# Altium project datalogger.PrjPcb (part 2 of 2)
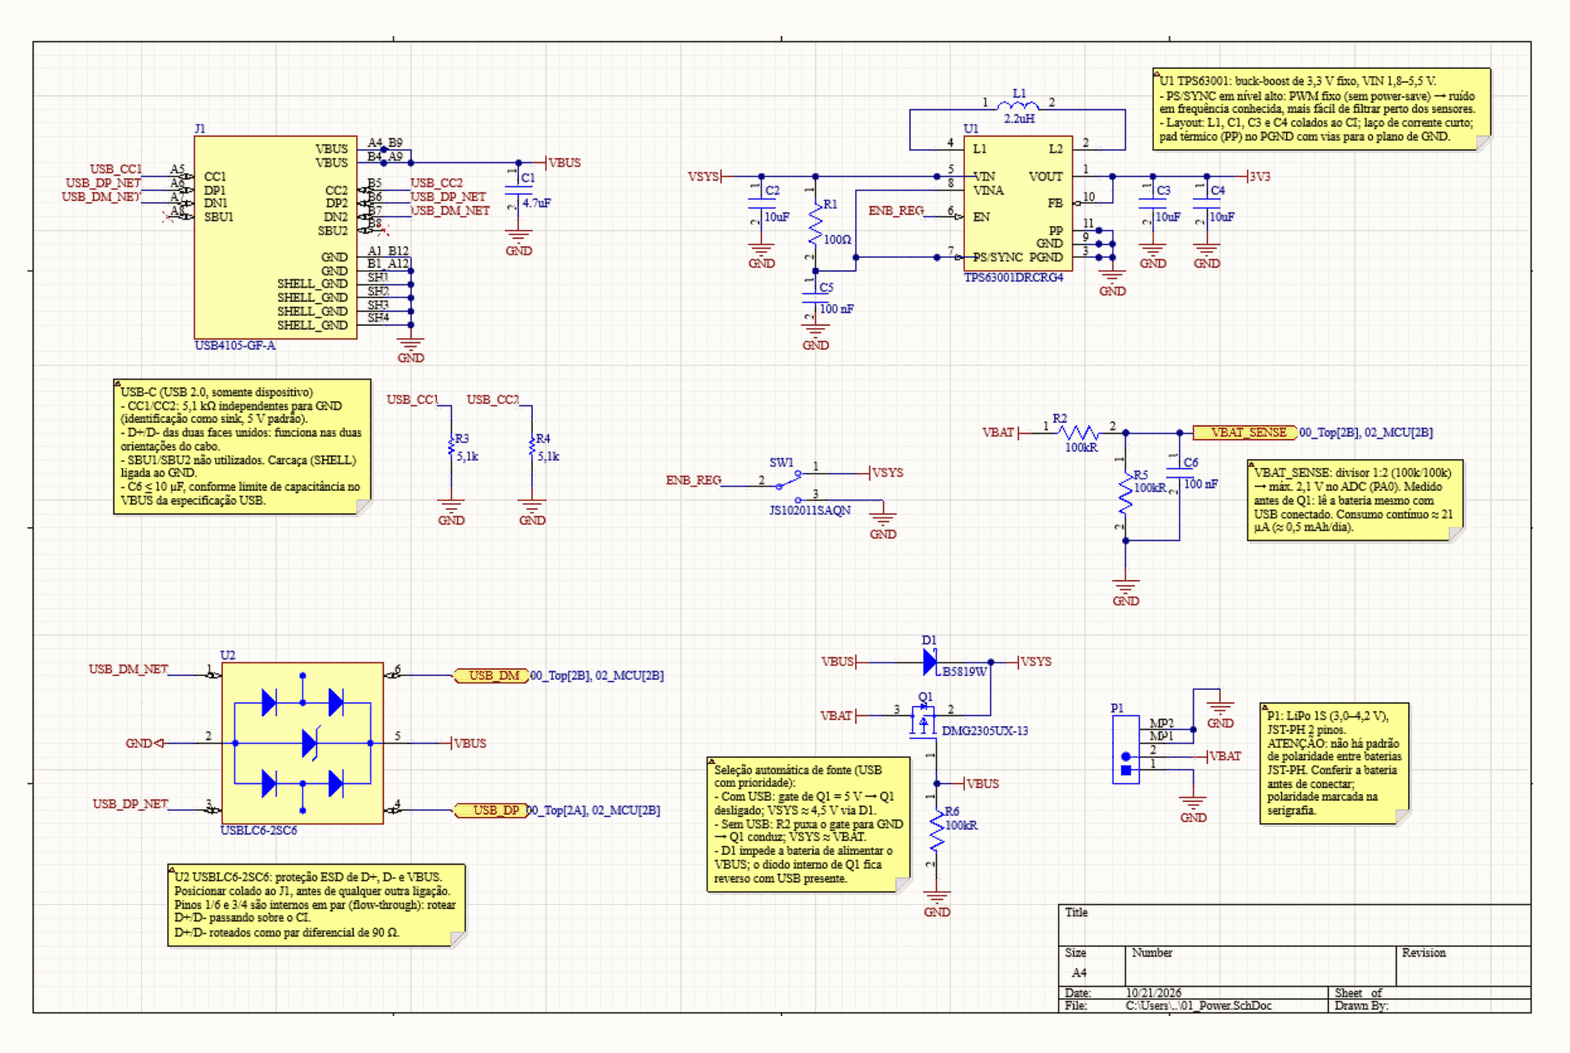
[diagram p7: 01_Power.SchDoc, right]

## Nets that join several sheets
3V3: 02_MCU (18 pins), 04_microSD (9 pins), 05_Interface (R17.1 SW4.1), 03_Sensors (12 pins), 01_Power (C3.1 C4.1 U1.1 U1.10)
GND: 02_MCU (29 pins), 04_microSD (8 pins), 05_Interface (D2.2 D3.1 D4.1 R18.2), 03_Sensors (12 pins), 01_Power (24 pins)
BME_SCL: 02_MCU (U3.8), 03_Sensors (R8.1 U5.4)
BME_SDA: 02_MCU (U3.9), 03_Sensors (R9.2 U5.3)
BTN: 02_MCU (U3.2), 05_Interface (R18.1 SW4.2)
IMU_CS: 02_MCU (U3.20), 03_Sensors (U4.12)
IMU_INT1: 02_MCU (U3.25), 03_Sensors (U4.4)
IMU_INT2: 02_MCU (U3.26), 03_Sensors (U4.9)
IMU_MISO: 02_MCU (U3.22), 03_Sensors (U4.1)
IMU_MOSI: 02_MCU (U3.23), 03_Sensors (U4.14)
IMU_SCK: 02_MCU (U3.21), 03_Sensors (U4.13)
LED_ERROR: 02_MCU (U3.59), 05_Interface (R19.1)
LED_STATUS: 02_MCU (U3.38), 05_Interface (R20.1)
SD_CD: 02_MCU (U3.41), 04_microSD (J4.10 R10.1)
SD_CK: 02_MCU (U3.53), 04_microSD (R16.2)
SD_CMD: 02_MCU (U3.54), 04_microSD (J4.3 R11.1)
SD_D0: 02_MCU (U3.39), 04_microSD (J4.7 R12.1)
SD_D1: 02_MCU (U3.40), 04_microSD (J4.8 R13.1)
SD_D2: 02_MCU (U3.51), 04_microSD (J4.1 R14.1)
SD_D3: 02_MCU (U3.52), 04_microSD (J4.2 R15.1)
USB_DM: 02_MCU (U3.44), 01_Power (U2.6)
USB_DP: 02_MCU (U3.45), 01_Power (U2.4)
VBAT_SENSE: 02_MCU (U3.14), 01_Power (C6.1 R2.2 R5.1)